# Altium schematic sheet [3] Fan.SchDoc
size A; Organization: Altium Limited; Address1: L3, 12a Rodborough Rd; Address2: Frenchs Forest; Address3: NSW; Address4: Australia 2086
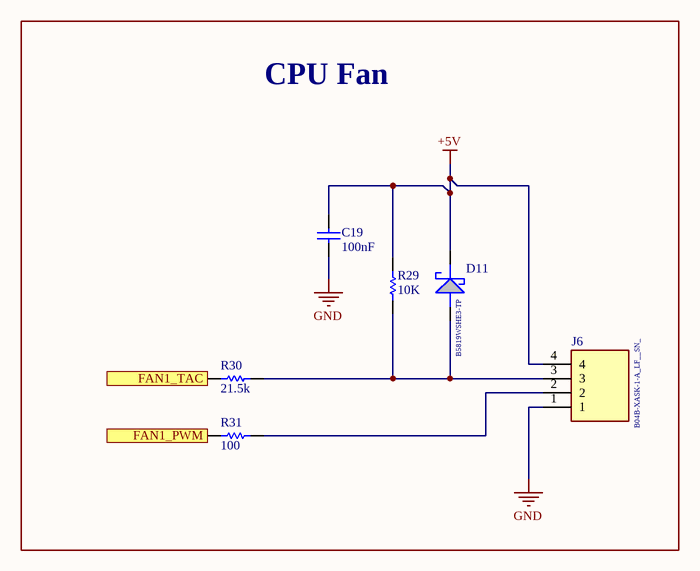
[diagram p0: [3] Fan.SchDoc]

## Parts
C19  100nF  [Capacitor 0402]
D11  B5819WSHE3-TP  [SOD2512X115N]
J6  B04B-XASK-1-A_LF__SN_  [B04BXASK1ALFSN]
R29  10K  [Resistencia 0402]
R30  21.5k  [Resistencia 0402]
R31  100  [Resistencia 0402]

## Blocks framed on the sheet
CPU Fan: C19 D11 J6 R29-R31

## Ports
FAN1_PWM (in), FAN1_TAC (out)

## Nets
+5V: C19.2 D11.1(K) J6.4 R29.2(B)
GND: C19.1 J6.1
FAN1_PWM: R31.1(A) ; port FAN1_PWM
FAN1_TAC: R30.1(A) ; port FAN1_TAC
NetD11_2: D11.2(A) J6.3 R29.1(A) R30.2(B)
NetJ6_2: J6.2 R31.2(B)

## Notes on the sheet
- Title
- Size:
- Date:
- A
- Number:
- Time:
- Revision:
- Sheet
- of
- File:

## Library data of the parts
C19 = Capacitor 0402: Capacitor Ceramico SMD 0402
D11 = B5819WSHE3-TP: 1 Amp Schottky Barrier Rectifier 20 - 40 Volts SOD-323; Manufacturer_Name: MCC; Geometry.Height: 1.15mm; Mouser Part Number: 833-B5819WSHE3-TP; Mouser Price/Stock: https://www.mouser.co.uk/ProductDetail/Micro-Commercial-Components-MCC/B5819WSHE3-TP?qs=rSMjJ%252B1ewcQA3fzC3crCWg%3D%3D; Manufacturer_Part_Number: B5819WSHE3-TP; Datasheet Link: https://www.mccsemi.com/pdf/Products/B5817WSHE3-B5819WSHE3(SOD-323).pdf
J6 = B04B-XASK-1-A_LF__SN_: Connector Header Through Hole 4 position 0.098" (2.50mm); Manufacturer_Name: JST (JAPAN SOLDERLESS TERMINALS); Manufacturer_Part_Number: B04B-XASK-1-A(LF)(SN); Geometry.Height: 8.8mm; Mouser Part Number: 306-B04BXASK1ALFSN; Mouser Price/Stock: https://www.mouser.co.uk/ProductDetail/JST-Commercial/B04B-XASK-1-ALFSN?qs=QpmGXVUTftEXYaWwXjA%2FfQ%3D%3D; Datasheet Link: https://www.jst-india.com/downloads/series/eXA-WB_(21-03-22).pdf
R29-R31 = Resistencia SMD 0402